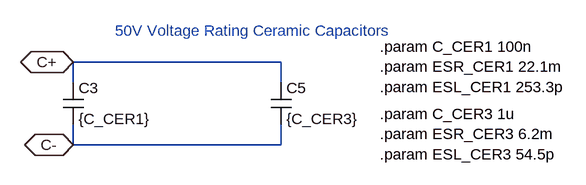
[diagram p0: schematic stack_cap_input.asc]
stack_cap_input.asc, the LTspice schematic file:
Version 4.1
SHEET 1 2304 692
WIRE 720 112 400 112
WIRE 400 144 400 112
WIRE 720 144 720 112
WIRE 400 240 400 208
WIRE 720 240 720 208
WIRE 720 240 400 240
FLAG 400 112 C+
IOPIN 400 112 BiDir
FLAG 400 240 C-
IOPIN 400 240 BiDir
SYMBOL cap 384 144 R0
SYMATTR InstName C3
SYMATTR Value {C_CER1}
SYMATTR SpiceLine Rser={ESR_CER1} Lser={ESL_CER1}
SYMBOL cap 704 144 R0
SYMATTR InstName C5
SYMATTR Value {C_CER3}
SYMATTR SpiceLine Rser={ESR_CER3} Lser={ESL_CER3}
TEXT 872 88 Left 2 !.param C_CER1 100n\n.param ESR_CER1 22.1m\n.param ESL_CER1 253.3p
TEXT 872 192 Left 2 !.param C_CER3 1u\n.param ESR_CER3 6.2m\n.param ESL_CER3 54.5p
TEXT 464 64 Left 2 ;50V Voltage Rating Ceramic Capacitors

The netlist it stands for:
* stack_cap_input.asc
C3 C+ C- {C_CER1} Rser={ESR_CER1} Lser={ESL_CER1}
C5 C+ C- {C_CER3} Rser={ESR_CER3} Lser={ESL_CER3}
.param C_CER1 100n
.param ESR_CER1 22.1m
.param ESL_CER1 253.3p
.param C_CER3 1u
.param ESR_CER3 6.2m
.param ESL_CER3 54.5p
* 50V Voltage Rating Ceramic Capacitors
.backanno
.end